# Altium project PoE_Controller_V1.0.PrjPcb (part 2 of 2)

## Sheet POE_Sheet.SchDoc
size A4; SheetNumber: 5; SheetTotal: 6
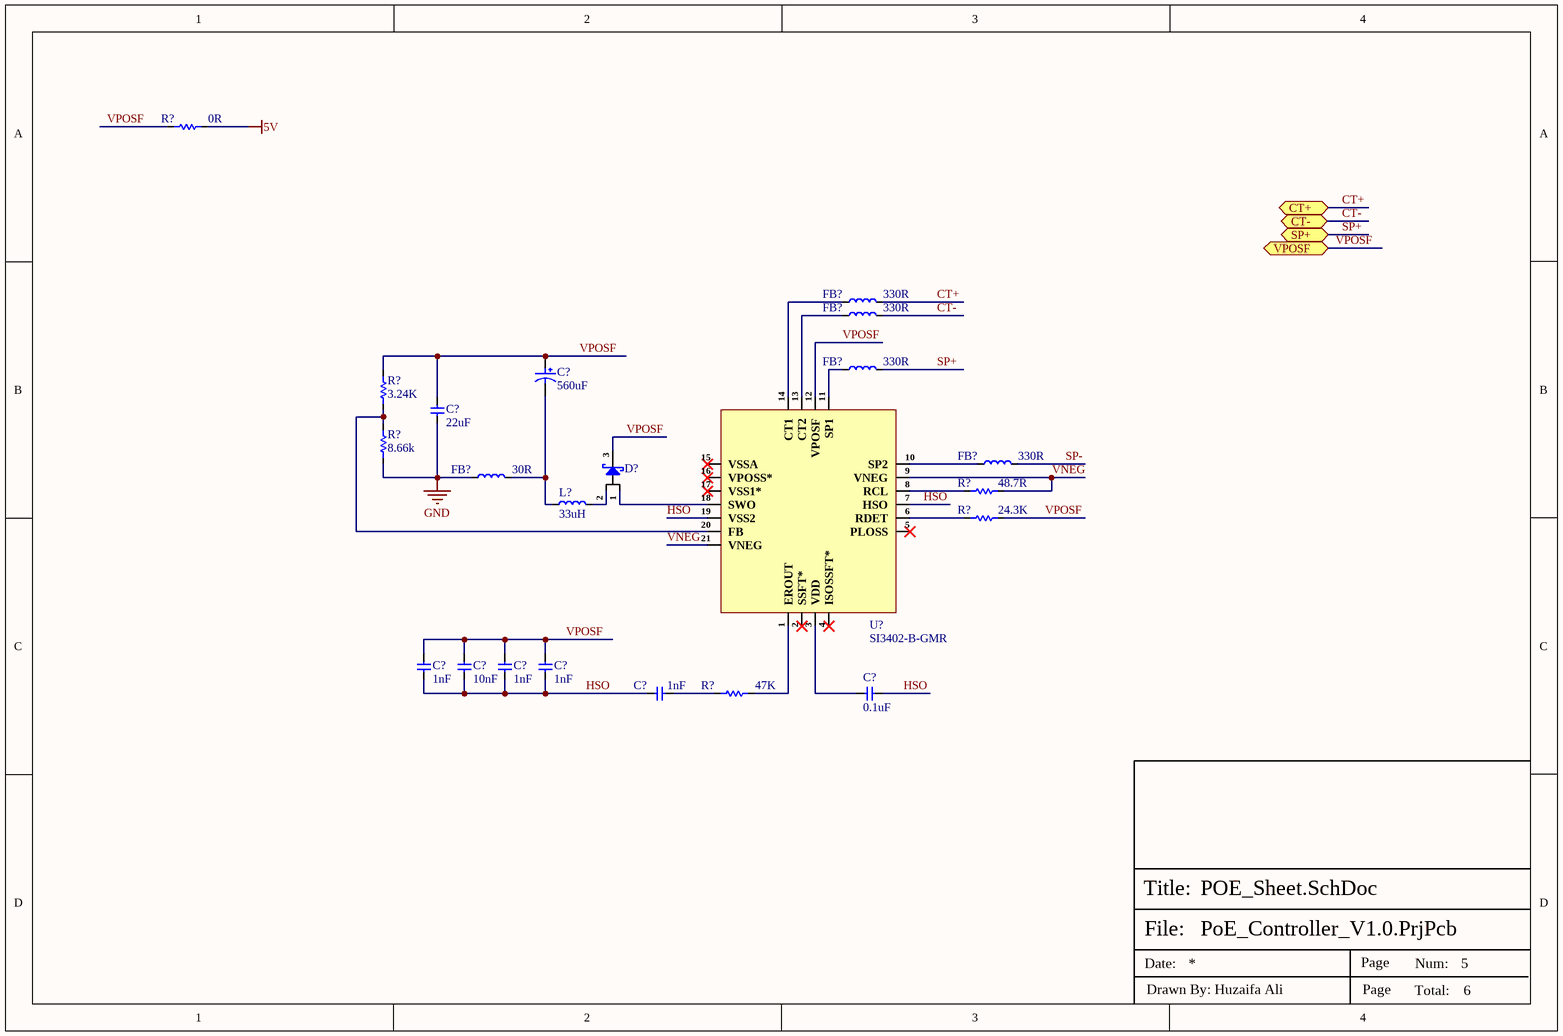
[diagram p4: POE_Sheet.SchDoc]

### Parts
(Parts that share a designator on the sheet are numbered #1, #2 ... from top to bottom, then left to right.)
C?#25  560uF  [GVT1C561M0810]
C?#26  22uF  [Cap-0805]
C?#27  1nF  [Cap-0603]
C?#28  10nF  [Cap-0603]
C?#29  1nF  [Cap-0603]
C?#30  1nF  [Cap-0603]
C?#31  1nF  [Cap-0603]
C?#32  0.1uF  [Cap-0603]
D?  PDS5100-13  [Power-DI-5]  (value not drawn)
FB?#1  330R  [Ind-0805]
FB?#2  330R  [Ind-0805]
FB?#3  330R  [Ind-0805]
FB?#4  330R  [Ind-0805]
FB?#5  30R  [IND-0603 (1608 Metric)]
L?#2  33uH  [MSS1278-333MLD]
R?#17  0R  [Res-0603]
R?#18  3.24K  [Res-0603]
R?#19  8.66k  [Res-0402]
R?#20  48.7R  [Res-0603]
R?#21  24.3K  [Res-0603]
R?#22  47K  [Res-0603]
U?#2  SI3402-B-GMR  [20-QFN (5x5)]

### Ports
CT+ (bidir, see Connector_Sheet[2D]), CT- (bidir, see Connector_Sheet[2D]), SP+ (bidir, see Connector_Sheet[2D]), VPOSF (bidir, see Connector_Sheet[2D])

### Nets
5V: R?#17.2
GND: C?#26.1 FB?#5.1 R?#19.1  [project net 3V3]
CT+: FB?#1.2 ; port CT+
CT-: FB?#2.2 ; port CT-
HSO: C?#27.1 C?#28.1 C?#29.1 C?#30.1 C?#31.1 C?#32.1 U?#2.7(HSO) U?#2.19(VSS2)
SP+: FB?#3.2 ; port SP+
SP-: FB?#4.2
VNEG: R?#20.2 U?#2.9(VNEG) U?#2.21(VNEG)
VPOSF: C?#25.1 C?#26.2 C?#27.2 C?#28.2 C?#29.2 C?#30.2 D?.3(K) R?#17.1 R?#18.2 R?#21.2 U?#2.12(VPOSF) ; port VPOSF
NetC?#25_2: C?#25.2 FB?#5.2 L?#2.2
NetC?#31_2: C?#31.2 R?#22.1
NetC?#32_2: C?#32.2 U?#2.3(VDD)
NetD?_1: D?.1(A) U?#2.18(SWO)
NetD?_2: D?.2(A) L?#2.1
NetFB?#1_1: FB?#1.1 U?#2.14(CT1)
NetFB?#2_1: FB?#2.1 U?#2.13(CT2)
NetFB?#3_1: FB?#3.1 U?#2.11(SP1)
NetFB?#4_1: FB?#4.1 U?#2.10(SP2)
NetR?#18_1: R?#18.1 R?#19.2 U?#2.20(FB)
NetR?#20_1: R?#20.1 U?#2.8(RCL)
NetR?#21_1: R?#21.1 U?#2.6(RDET)
NetR?#22_2: R?#22.2 U?#2.1(EROUT)

Not connected (* = marked no-connect by the designer): U?#2 2(SSFT*)* 4(ISOSSFT*)* 5(PLOSS)* 15(VSSA)* 16(VPOSS*)* 17(VSS1*)*

### Notes on the sheet
- File:
- Title:
- Date:
- Page
- Num:
- Total:
- Drawn By: Huzaifa Ali

### Library data of the parts
C?#25 = GVT1C561M0810: 560uF 16V ±20% SMD,D8xL10.5mm Aluminum Electrolytic Capacitors - SMD ROHS; Manufacturer: Honor Elec; Manufacturer Part Number: GVT1C561M0810; Package: SMD,D8xL10.5mm; LCSC Part Number: C2980166; Item Type: Capacitor; ComponentLink1Description: LCSC; ComponentLink1URL: https://www.lcsc.com/product-detail/span-style-background-color-ff0-Aluminum-span-span-style-background-color-ff0-Electrolytic-span-span-style-background-color-ff0-Capacitors-span-span-style-background-color-ff0-SMD-span_Honor-Elec-GVT1C561M0810_C2980166.html
C?#26 = CC0805MKX5R8BB226: CAP CER 22UF 25V X5R 0805; Manufacturer: Yageo; Tolerance: 20%; Item Type: Capacitor; Supplier 1: Digi-Key; Manufacturer Part Number: CC0805MKX5R8BB226; RoHS: Yes; Category: Ceramic Capacitors; Stock 1: 64970; Pricing 1: 1=0.47000, 10=0.33300, 50=0.25140, 100=0.21900, 500=0.16222, 1000=0.13789 (USD); Mount: Surface Mount; Case/Package: 0805; Case Code (Metric): 2012; Case Code (Imperial): 0805; Weight: 0.000194oz; Min Operating Temperature: -55°C; Max Operating Temperature: 85°C; Packaging: Tape and Reel; Capacitance: 22uF; Voltage Rating: 25V; Dielectric: X5R; Termination: SMD/SMT; Voltage Rating (DC): 25V; Package Quantity: 3000; Length: 0.079inch; Width: 0.049inch; Height: 1.25mm; Thickness: 0.057inch; Lead Free: Lead Free; Halogen Free: Halogen Free; RoHS Compliant: Yes; ComponentLink1URL: http://www.mouser.com/ds/2/447/Yageo_UPY-GP_NP0_16V-to-50V_9-358835.pdf?src-supplier=Mouser; ComponentLink1Description: http://www.mouser.com/ds/2/447/Yageo_UPY-GP_NP0_16V-to-50V_9-358835.pdf?src-supplier=Mouser; ComponentLink2URL: http://www.yageo.com/documents/recent/UPY-GPHC_X5R_4V-to-50V_25.pdf?src-supplier=Digi-Key; ComponentLink2Description: http://www.yageo.com/documents/recent/UPY-GPHC_X5R_4V-to-50V_25.pdf?src-supplier=Digi-Key; Supplier Part Number 1: 311-1903-1-ND; LCSC Part Number: C784585
C?#27 C?#29-C?#31 = CL10C102JB8NNNC: CAP CER 1000PF 50V C0G/NP0 0603; Manufacturer: Samsung; Material: Ceramic; Tolerance: 5%; Dielectric: C0G; Temperature Coefficient: 300ppm/°C; Item Type: Capacitor; Supplier 1: RSComponents; Manufacturer Part Number: CL10C102JB8NNNC; RoHS: Yes; Category: Ceramic Capacitors; Stock 1: 616000; Pricing 1: 4000=0.00600, 12000=0.00600, 20000=0.00600, 40000=0.00500, 100000=0.00500 (GBP); Mount: Surface Mount; Case/Package: 0603; Case Code (Metric): 1608; Case Code (Imperial): 0603; Min Operating Temperature: -55°C; Max Operating Temperature: 125°C; Capacitance: 1nF; Voltage: 50V; Voltage Rating (DC): 50V; Voltage Rating: 50V; Packaging: Tape and Reel; Package Quantity: 1; Series: CL; Length: 1.6mm; Width: 0.031inch; Height: 0.8mm; Depth: 0.8mm; Thickness: 0.035inch; Radiation Hardening: No; Lead Free: Lead Free; RoHS Compliant: Yes; ComponentLink1URL: https://datasheet.ciiva.com/15195/getdatasheetpartid-354056-15195790.pdf?src-supplier=Verical; ComponentLink1Description: https://datasheet.ciiva.com/15195/getdatasheetpartid-354056-15195790.pdf?src-supplier=Verical; ComponentLink2URL: https://datasheet.ciiva.com/29198/458273-da-01-en-vs-kondensator-0603-29198494.pdf?src-supplier=Conrad; ComponentLink2Description: https://datasheet.ciiva.com/29198/458273-da-01-en-vs-kondensator-0603-29198494.pdf?src-supplier=Conrad; ComponentLink3URL: https://datasheet.ciiva.com/26310/mlcc-catalogdownload2013-eng-26310329.pdf?src-supplier=Distrelec; ComponentLink3Description: https://datasheet.ciiva.com/26310/mlcc-catalogdownload2013-eng-26310329.pdf?src-supplier=Distrelec; Supplier Part Number 1: 7665279; LCSC Part Number: C163508
C?#28 = CC0603KRX7R9BB103: CAP CER 10000PF 50V X7R 0603; Manufacturer: Yageo; Material: Ceramic; Tolerance: 10%; Insulation Resistance: 100GR; Supplier 1: Digi-Key; Manufacturer Part Number: CC0603KRX7R9BB103; Stock 1: 8411467; Pricing 1: 1=0.1, 10=0.038, 100=0.0171, 500=0.01224, 1000=0.00962 (USD); Mount: Surface Mount; Case/Package: 0603; Number of Pins: 2; Case Code (Metric): 1608; Case Code (Imperial): 0603; Min Operating Temperature: -55°C; Max Operating Temperature: 125°C; Capacitance: 10nF; Dielectric: X7R; Voltage: 50V; Packaging: Tape and Reel; Voltage Rating: 50V; Voltage Rating (DC): 50V; Package Quantity: 1; Termination: SMD/SMT; Composition: Ceramic; Length: 1.6mm; Height: 0.8mm; Width: 0.031inch; Thickness: 0.035inch; Depth: 0.8mm; Radiation Hardening: No; REACH SVHC: No SVHC; Lead Free: Lead Free; Halogen Free: Halogen Free; ComponentLink1URL: http://www.farnell.com/datasheets/1734573.pdf?src-supplier=Element14; ComponentLink1Description: http://www.farnell.com/datasheets/1734573.pdf?src-supplier=Element14; ComponentLink2URL: http://www.yageo.com/documents/recent/UPY-GPHC_X7R_6.3V-to-50V_18.pdf?src-supplier=Digi-Key; ComponentLink2Description: http://www.yageo.com/documents/recent/UPY-GPHC_X7R_6.3V-to-50V_18.pdf?src-supplier=Digi-Key; ComponentLink3URL: http://www.farnell.com/datasheets/2167236.pdf?src-supplier=Mouser; ComponentLink3Description: http://www.farnell.com/datasheets/2167236.pdf?src-supplier=Mouser; ComponentLink4URL: http://www.farnell.com/datasheets/70765.pdf?src-supplier=Element14; ComponentLink4Description: http://www.farnell.com/datasheets/70765.pdf?src-supplier=Element14; ComponentLink5URL: http://www.yageo.com/documents/recent/UPY-GPHC_X7R_6.3V-to-50V_8.pdf?src-supplier=Avnet+Europe; ComponentLink5Description: http://www.yageo.com/documents/recent/UPY-GPHC_X7R_6.3V-to-50V_8.pdf?src-supplier=Avnet+Europe; ComponentLink6URL: http://www.farnell.com/datasheets/1489800.pdf?src-supplier=Element14; ComponentLink6Description: http://www.farnell.com/datasheets/1489800.pdf?src-supplier=Element14; ComponentLink7URL: https://www.verical.com/server-webapp/html/getDatasheet?partID=403582&src-supplier=Verical; ComponentLink7Description: https://www.verical.com/server-webapp/html/getDatasheet?partID=403582&src-supplier=Verical; Supplier Part Number 1: 311-1085-6-ND; LCSC Part Number: C100042
C?#32 = CL10B104KB8NNNC: CAP CER 0.1UF 50V X7R 0603; Manufacturer: Samsung; Material: Ceramic; Capacitance: 100nF; Tolerance: 10%; Supplier 1: Digi-Key; Manufacturer Part Number: CL10B104KB8NNNC; RoHS: Yes; Category: Ceramic Capacitors; Stock 1: 3998791; Pricing 1: 1=0.10000, 10=0.03000, 50=0.01640, 100=0.01340, 500=0.00954, 1000=0.00750 (USD); Mount: Surface Mount; Case/Package: 0603; Case Code (Metric): 1608; Case Code (Imperial): 0603; Contact Plating: Tin; Min Operating Temperature: -55°C; Max Operating Temperature: 125°C; Dielectric: X7R; Voltage Rating: 50V; Package Quantity: 1; Packaging: Tape and Reel; Voltage: 50V; Voltage Rating (DC): 50V; Series: CL; Construction: Flat; Length: 1.6mm; Width: 0.031inch; Height: 0.8mm; Depth: 0.8mm; Thickness: 0.035inch; Radiation Hardening: No; Lead Free: Lead Free; RoHS Compliant: Yes; ComponentLink1URL: https://datasheet.ciiva.com/25803/cl10b104kb8nnnc-25803393.pdf?src-supplier=Digi-Key; ComponentLink1Description: https://datasheet.ciiva.com/25803/cl10b104kb8nnnc-25803393.pdf?src-supplier=Digi-Key; ComponentLink2URL: https://datasheet.ciiva.com/26838/getdatasheetpartid-89097-26838411.pdf?src-supplier=Verical; ComponentLink2Description: https://datasheet.ciiva.com/26838/getdatasheetpartid-89097-26838411.pdf?src-supplier=Verical; ComponentLink3URL: https://datasheet.ciiva.com/29198/456651-da-01-en-vs-kondensator-0605-29198839.pdf?src-supplier=Conrad; ComponentLink3Description: https://datasheet.ciiva.com/29198/456651-da-01-en-vs-kondensator-0605-29198839.pdf?src-supplier=Conrad; Supplier Part Number 1: 1276-1000-1-ND; LCSC Part Number: C1591
D? = PDS5100-13: DIODE SCHOTTKY 100V 5A POWERDI5; Manufacturer: Diodes; Supplier: Future Electronics; Supplier Part Number: 7587892; Manufacturer Part Number: PDS5100-13; RoHS: Yes; Item Type: Diode; Stock: 15000; Pricing: 5000=0.51, 10000=0.49 (USD); ComponentLink1URL: https://datasheet.ciiva.com/4715/ds30483-85202-4715621.pdf?src-supplier=Mouser; ComponentLink1Description: https://datasheet.ciiva.com/4715/ds30483-85202-4715621.pdf?src-supplier=Mouser; ComponentLink2URL: https://datasheet.ciiva.com/23710/ds30483-23710529.pdf?src-supplier=Newark; ComponentLink2Description: https://datasheet.ciiva.com/23710/ds30483-23710529.pdf?src-supplier=Newark; ComponentLink3URL: https://datasheet.ciiva.com/8301/ds30483-8301032.pdf?src-supplier=Avnet; ComponentLink3Description: https://datasheet.ciiva.com/8301/ds30483-8301032.pdf?src-supplier=Avnet; ComponentLink4URL: https://datasheet.ciiva.com/8301/ds30483-8301036.pdf?src-supplier=Avnet; ComponentLink4Description: https://datasheet.ciiva.com/8301/ds30483-8301036.pdf?src-supplier=Avnet; ComponentLink5URL: https://datasheet.ciiva.com/915/ds30483-915146.pdf?src-supplier=Digikey; ComponentLink5Description: https://datasheet.ciiva.com/915/ds30483-915146.pdf?src-supplier=Digikey; ComponentLink6URL: https://datasheet.ciiva.com/915/ds30483-915147.pdf?src-supplier=Digikey; ComponentLink6Description: https://datasheet.ciiva.com/915/ds30483-915147.pdf?src-supplier=Digikey; ComponentLink7URL: https://datasheet.ciiva.com/915/ds30483-915148.pdf?src-supplier=Digikey; ComponentLink7Description: https://datasheet.ciiva.com/915/ds30483-915148.pdf?src-supplier=Digikey
FB?#1-FB?#4 = BLM21PG331SN1D: FERRITE BEAD 330 OHM 0805 1LN; Manufacturer: Murata; Number of Circuits: 1NUMBER; RMS Current (Irms): 1.5A; ESR: 70mR; Shielding: 202Shielding; Supplier: Mouser; Supplier Part Number: 81-BLM21P331SG; Manufacturer Part Number: BLM21PG331SN1D; RoHS: Yes; Category: Ferrite Beads and Chips; Stock: 246053; Pricing: 1=0.12, 10=0.064, 50=0.064, 100=0.044, 1000=0.031, 10000=0.025 (USD); Lead Free: 5697LeadFree; ComponentLink1URL: https://datasheet.ciiva.com/11799/0900766b81275e31-11799231.pdf?src-supplier=Rs; ComponentLink1Description: https://datasheet.ciiva.com/11799/0900766b81275e31-11799231.pdf?src-supplier=Rs; ComponentLink2URL: https://datasheet.ciiva.com/19460/1845347-19460239.pdf?src-supplier=Jameco; ComponentLink2Description: https://datasheet.ciiva.com/19460/1845347-19460239.pdf?src-supplier=Jameco; ComponentLink3URL: https://datasheet.ciiva.com/14122/anblm21p-data-e-14122215.pdf?src-supplier=Distrelec; ComponentLink3Description: https://datasheet.ciiva.com/14122/anblm21p-data-e-14122215.pdf?src-supplier=Distrelec; ComponentLink4URL: https://datasheet.ciiva.com/3081/l0110s0100blm21p-3081659.pdf?src-supplier=Avnet; ComponentLink4Description: https://datasheet.ciiva.com/3081/l0110s0100blm21p-3081659.pdf?src-supplier=Avnet; ComponentLink5URL: https://datasheet.ciiva.com/6211/l0110s0100blm21p-6211749.pdf?src-supplier=Digikey; ComponentLink5Description: https://datasheet.ciiva.com/6211/l0110s0100blm21p-6211749.pdf?src-supplier=Digikey; ComponentLink6URL: https://datasheet.ciiva.com/6211/l0110s0100blm21p-6211753.pdf?src-supplier=Digikey; ComponentLink6Description: https://datasheet.ciiva.com/6211/l0110s0100blm21p-6211753.pdf?src-supplier=Digikey; ComponentLink7URL: https://datasheet.ciiva.com/6211/l0110s0100blm21p-6211754.pdf?src-supplier=Digikey; ComponentLink7Description: https://datasheet.ciiva.com/6211/l0110s0100blm21p-6211754.pdf?src-supplier=Digikey; ComponentLink8URL: https://datasheet.ciiva.com/41449/001172367-da-01-en-drossel-0805-330r-2-0x1-25mm-4000st-41449610.pdf?src-supplier=Conrad; ComponentLink8Description: https://datasheet.ciiva.com/41449/001172367-da-01-en-drossel-0805-330r-2-0x1-25mm-4000st-41449610.pdf?src-supplier=Conrad
FB?#5 = BLM18PG300SN1D: FERRITE BEAD 30 OHM 0603 1LN / Ferrite Beads Multi-Layer 30Ohm 100MHz 1A 0.05Ohm DCR 0603 T/R; Manufacturer: Murata; Material: Steel,Ferrite; Tolerance: 25%; DC Resistance (DCR): 50mR; Number of Lines: 1; Shielding: Unshielded; Supplier 1: RSComponents; Manufacturer Part Number: BLM18PG300SN1D; RoHS: Yes; Category: Inductors; Stock 1: 3100; Pricing 1: 25=0.07200, 1000=0.06200, 2000=0.05400, 5000=0.04700, 10000=0.04300 (GBP); Case/Package: 0603; Number of Pins: 2; Core Material: Ferrite; Case Code (Metric): 1608; Case Code (Imperial): 0603; Min Operating Temperature: -55°C; Max Operating Temperature: 125°C; Impedance: 30R; Package Quantity: 4000; Max Current Rating: 1A; Packaging: Tape and Reel; Current Rating: 1A; Max DC Current: 1A; Termination: SMD/SMT; Test Frequency: 100MHz; DC Current: 1A; Frequency: 100MHz; Number of Circuits: 1; Series: BLM18P; DC Resistance-Max: 50mR; Length: 1.6mm; Width: 0.8mm; Height: 0.8mm; Depth: 0.8mm; Radiation Hardening: No; REACH SVHC: No SVHC; Lead Free: Lead Free; RoHS Compliant: Yes; ComponentLink1URL: https://datasheet.ciiva.com/19460/1845048-19460200.pdf?src-supplier=Jameco; ComponentLink1Description: https://datasheet.ciiva.com/19460/1845048-19460200.pdf?src-supplier=Jameco; ComponentLink2URL: https://datasheet.ciiva.com/11800/0900766b81275ca5-11800868.pdf?src-supplier=RSComponents; ComponentLink2Description: https://datasheet.ciiva.com/11800/0900766b81275ca5-11800868.pdf?src-supplier=RSComponents; ComponentLink3URL: https://datasheet.ciiva.com/8021/5148-8021484.pdf?src-supplier=Element14; ComponentLink3Description: https://datasheet.ciiva.com/8021/5148-8021484.pdf?src-supplier=Element14; ComponentLink4URL: https://datasheet.ciiva.com/8021/5148-8021486.pdf?src-supplier=Element14; ComponentLink4Description: https://datasheet.ciiva.com/8021/5148-8021486.pdf?src-supplier=Element14; ComponentLink5URL: https://datasheet.ciiva.com/1012/l0110s0100blm18p-1012120.pdf?src-supplier=Digi-Key; ComponentLink5Description: https://datasheet.ciiva.com/1012/l0110s0100blm18p-1012120.pdf?src-supplier=Digi-Key; ComponentLink6URL: https://datasheet.ciiva.com/1012/l0110s0100blm18p-1012119.pdf?src-supplier=Digi-Key; ComponentLink6Description: https://datasheet.ciiva.com/1012/l0110s0100blm18p-1012119.pdf?src-supplier=Digi-Key; ComponentLink7URL: https://datasheet.ciiva.com/1012/l0110s0100blm18p-1012121.pdf?src-supplier=Digi-Key; ComponentLink7Description: https://datasheet.ciiva.com/1012/l0110s0100blm18p-1012121.pdf?src-supplier=Digi-Key; ComponentLink8URL: https://datasheet.ciiva.com/3081/l0110s0100blm18p-3081636.pdf?src-supplier=Avnet; ComponentLink8Description: https://datasheet.ciiva.com/3081/l0110s0100blm18p-3081636.pdf?src-supplier=Avnet; Supplier Part Number 1: 7241403; LCSC Part Number: C17305; Item Type: Ferrite Bead
L?#2 = MSS1278-333MLD: POWER INDUCTOR, SHIELDED, 10/20%; Manufacturer: Coilcraft; Item Type: Fixed Inductors; Core Material: Ferrite; Self Resonant Frequency: 9.5MHz; Tolerance: 20%; Max DC Current: 3.1A; Test Frequency: 100kHz; Saturation Current: 5.22A; Supplier: Mouser; Supplier Part Number: 994-MSS1278-333MLD; Manufacturer Part Number: MSS1278-333MLD; RoHS: Yes; Stock: 37813; Pricing: 1=2.92, 10=2.92, 50=2.92, 100=2.92, 1000=1.19, 10000=1.19 (USD); Mounting Technology: Surface Mount; Case/Package: SMD/SMT; Min Operating Temperature: -40°C; Max Operating Temperature: 85°C; Packaging: Tape and Reel; Package Quantity: 500; Shielding: Shielded; Value: 33uH; Termination: SMD/SMT; Series: MSS1278; Inductance Tolerance: 20%; RMS Current (Irms): 3.1A; Length: 12.3mm; Width: 12.3mm; Height: 8.05mm; Lead Free: Contains Lead; RoHS Compliant: Yes; Reach SVHC Compliant: No; ComponentLink1URL: https://datasheet.ciiva.com/22707/1681956-22707189.pdf?src-supplier=Element14; ComponentLink1Description: https://datasheet.ciiva.com/22707/1681956-22707189.pdf?src-supplier=Element14; ComponentLink2URL: https://datasheet.ciiva.com/22707/1681956-22707190.pdf?src-supplier=Element14; ComponentLink2Description: https://datasheet.ciiva.com/22707/1681956-22707190.pdf?src-supplier=Element14; ComponentLink3URL: https://datasheet.ciiva.com/13320/mss1278-270709-13320521.pdf?src-supplier=Mouser; ComponentLink3Description: https://datasheet.ciiva.com/13320/mss1278-270709-13320521.pdf?src-supplier=Mouser
R?#17 = RC0603FR-070RL: RES SMD 0R, 1%, 0.1W, 0603; Manufacturer: Yageo; Item Type: Resistor; Manufacturer Part Number: RC0603FR-070RL; Package: 0603; LCSC Part Number: C100044; ComponentLink9Description: LCSC; ComponentLink9URL: https://www.lcsc.com/product-detail/Chip-Resistor-Surface-Mount_YAGEO-RC0603FR-070RL_C100044.html
R?#18 = 0603WAF3241T5E: 100mW Thick Film Resistors ±1% 3.24kΩ 0603 Chip Resistor - Surface Mount ROHS; Manufacturer: UNI-ROYAL; Manufacturer Part Number: 0603WAF3241T5E; Package: 0603; LCSC Part Number: C22994; Item Type: Resistor; ComponentLink1Description: LCSC; ComponentLink1URL: https://www.lcsc.com/product-detail/Chip-Resistor-Surface-Mount_UNI-ROYAL-Uniroyal-Elec-0603WAF3241T5E_C22994.html
R?#19 = RT0402BRD078K66L: RES SMD 8.66KOHM 0.1% 1/16W 0402; Manufacturer: Yageo; Item Type: Resistor; Supplier: Mouser; Supplier Part Number: 603-RT0402BRD078K66L; Manufacturer Part Number: RT0402BRD078K66L; RoHS: Yes; Category: Chip SMD Resistors; Stock: 7615; Pricing: 1=0.38, 10=0.171, 50=0.171, 100=0.077, 1000=0.052, 10000=0.041 (USD); ComponentLink1URL: https://datasheet.ciiva.com/12721/pyu-rt-1-to-0-05-rohs-l-4-12721182.pdf?src-supplier=Mouser; ComponentLink1Description: https://datasheet.ciiva.com/12721/pyu-rt-1-to-0-05-rohs-l-4-12721182.pdf?src-supplier=Mouser; ComponentLink2URL: https://datasheet.ciiva.com/2582/pyu-rt-1-to-0-05-rohs-l-5-2582522.pdf?src-supplier=Digikey; ComponentLink2Description: https://datasheet.ciiva.com/2582/pyu-rt-1-to-0-05-rohs-l-5-2582522.pdf?src-supplier=Digikey; LCSC Part Number: C852945
R?#20 = RC0603FR-0748R7L: RES 48.7 OHM 1% 1/10W 0603; Manufacturer: Yageo; Item Type: Resistor; Supplier: Future Electronics; Supplier Part Number: 1337532; Manufacturer Part Number: RC0603FR-0748R7L; RoHS: Yes; Stock: 80000; Pricing: 5000=0.0012, 75000=0.0012, 200000=0.0011, 500000=0.0011, 1250000=0.001 (USD); ComponentLink1URL: https://datasheet.ciiva.com/8888/pyu-rc0603-51-rohs-l-4-8888942.pdf?src-supplier=Avnet; ComponentLink1Description: https://datasheet.ciiva.com/8888/pyu-rc0603-51-rohs-l-4-8888942.pdf?src-supplier=Avnet
R?#21 = RC0603FR-0724K3L: RES 24.3K OHM 1% 1/10W 0603; Manufacturer: Yageo; Item Type: Resistors; Voltage Rating (DC): 50V; Supplier: Future Electronics; Supplier Part Number: 6938161; Manufacturer Part Number: RC0603FR-0724K3L; RoHS: Yes; Stock: 440000; Pricing: 5000=0.0015, 50000=0.0014, 150000=0.0014, 375000=0.0013, 1000000=0.0012 (USD); Lead Free: 5697LeadFree; ComponentLink1URL: https://datasheet.ciiva.com/15189/getdatasheetpartid-326710-15189669.pdf?src-supplier=Verical; ComponentLink1Description: https://datasheet.ciiva.com/15189/getdatasheetpartid-326710-15189669.pdf?src-supplier=Verical
R?#22 = RT0603BRD0747KL: RES SMD 47K OHM 0.1% 1/10W 0603; Manufacturer: Yageo; Voltage Rating: 75V; Resistance: 47kR; Power Rating: 100mW; Temperature Coefficient: 25ppm/°C; Voltage Rating (DC): 50V; Item Type: Resistor; Supplier 1: Arrow Electronics; Manufacturer Part Number: RT0603BRD0747KL; RoHS: Yes; Category: Chip SMD Resistors; Stock 1: 5153; Pricing 1: 1=0.29190, 10=0.22910, 25=0.22680, 100=0.09530, 250=0.09440, 500=0.09340, 1000=0.04780, 3000=0.03070 (USD); Case/Package: 0603; Case Code (Metric): 1608; Case Code (Imperial): 0603; Contact Plating: Tin,Lead; Min Operating Temperature: -55°C; Max Operating Temperature: 125°C; Packaging: Tape and Reel; Package Quantity: 5000; Resistor Type: Thin Film; Termination: SMD/SMT; Number of Terminations: 2; Max Power Dissipation: 100mW; Features: Moisture Resistant; Series: RT; Construction: Rectangular; Length: 0.063inch; Width: 0.031inch; Height: 0.022inch; Depth: 0.8mm; Military Standard: Not; Lead Free: Lead Free; RoHS Compliant: Yes; ComponentLink1URL: https://datasheet.ciiva.com/2585/pyu-rt-1-to-0-05-rohs-l-4-2585964.pdf?src-supplier=Digi-Key; ComponentLink1Description: https://datasheet.ciiva.com/2585/pyu-rt-1-to-0-05-rohs-l-4-2585964.pdf?src-supplier=Digi-Key; ComponentLink2URL: https://datasheet.ciiva.com/46635/pyu-rt-1-to-0-05-rohs-l-5-46635309.pdf?src-supplier=Digi-Key; ComponentLink2Description: https://datasheet.ciiva.com/46635/pyu-rt-1-to-0-05-rohs-l-5-46635309.pdf?src-supplier=Digi-Key; Supplier Part Number 1: RT0603BRD0747KL; LCSC Part Number: C326725
U?#2 = SI3402-B-GMR: IC POE CNTRL 1 CHANNEL 20QFN; Manufacturer: Skyworks Solutions; Supplier: Digikey; Supplier Part Number: 336-4152-1-ND; Manufacturer Part Number: SI3402-B-GMR; RoHS: No; Item Type: IC; Stock: 11442; Pricing: 1=2.8, 10=2.516, 25=2.3736, 100=2.0222, 250=1.8988, 500=1.66144, 1000=1.37663 (USD)

## Sheet Connector_Sheet.SchDoc
size A4; SheetNumber: 6; SheetTotal: 6
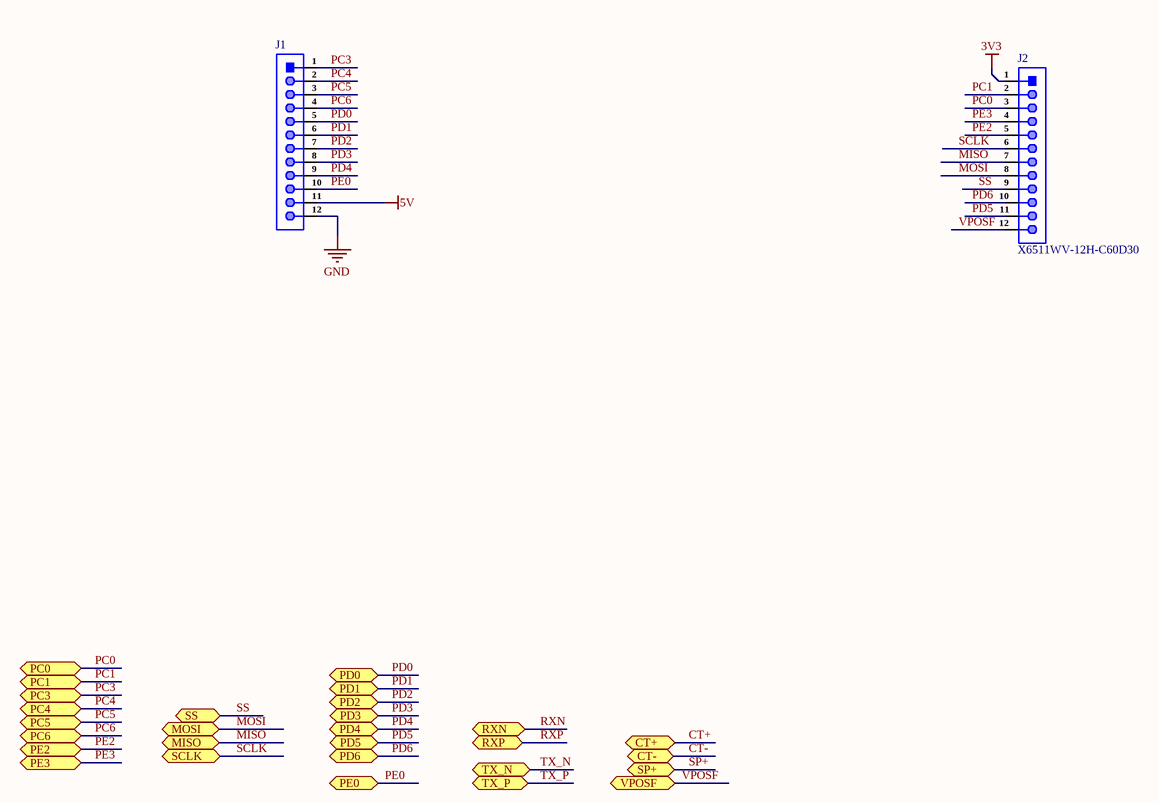
[diagram p5: Connector_Sheet.SchDoc]

### Parts
J1  X6511WV-12H-C60D30  [HDR 1x12 TH]  (value not drawn)
J2  X6511WV-12H-C60D30  [HDR 1x12 TH]

### Ports
CT+ (bidir, see POE_Sheet[4A]), CT- (bidir, see POE_Sheet[4A]), MISO (bidir, see Controller_Sheet[4B], Ethernet_Sheet[1D]), MOSI (bidir, see Controller_Sheet[4B], Ethernet_Sheet[1D]), PC0 (bidir, see Controller_Sheet[4B]), PC1 (bidir, see Controller_Sheet[4B]), PC3 (bidir, see Controller_Sheet[4B]), PC4 (bidir, see Controller_Sheet[4B]), PC5 (bidir, see Controller_Sheet[4B]), PC6 (bidir, see Controller_Sheet[4B]), PD0 (bidir, see Controller_Sheet[4C]), PD1 (bidir, see Controller_Sheet[4C]), PD2 (bidir, see Controller_Sheet[4C]), PD3 (bidir, see Controller_Sheet[4C]), PD4 (bidir, see Controller_Sheet[4C]), PD5 (bidir, see Controller_Sheet[4C]), PD6 (bidir, see Controller_Sheet[4C]), PE0 (bidir, see Controller_Sheet[4C]), PE2 (bidir, see Controller_Sheet[4B]), PE3 (bidir, see Controller_Sheet[4B]), RXN (bidir, see Ethernet_Sheet[1C]), RXP (bidir, see Ethernet_Sheet[1C]), SCLK (bidir, see Controller_Sheet[4B], Ethernet_Sheet[1D]), SP+ (bidir, see POE_Sheet[4A]), SS (bidir, see Controller_Sheet[4B]), TX_N (bidir, see Ethernet_Sheet[1C]), TX_P (bidir, see Ethernet_Sheet[1C]), VPOSF (bidir, see POE_Sheet[4A])

### Nets
3V3: J1.12 J2.1  [also labelled GND]
5V: J1.11
MISO: J2.7 ; port MISO
MOSI: J2.8 ; port MOSI
PC0: J2.3 ; port PC0
PC1: J2.2 ; port PC1
PC3: J1.1 ; port PC3
PC4: J1.2 ; port PC4
PC5: J1.3 ; port PC5
PC6: J1.4 ; port PC6
PD0: J1.5 ; port PD0
PD1: J1.6 ; port PD1
PD2: J1.7 ; port PD2
PD3: J1.8 ; port PD3
PD4: J1.9 ; port PD4
PD5: J2.11 ; port PD5
PD6: J2.10 ; port PD6
PE0: J1.10 ; port PE0
PE2: J2.5 ; port PE2
PE3: J2.4 ; port PE3
SCLK: J2.6 ; port SCLK
SS: J2.9 ; port SS
VPOSF: J2.12 ; port VPOSF

### Notes on the sheet
- File:
- Title:
- Date:
- Page
- Num:
- Total:
- Drawn By: Huzaifa Ali

### Library data of the parts
J1 J2 = X6511WV-12H-C60D30: Gold 250V 3A Square Pins 2.5mm 12P 260℃ 6mm -40℃~+105℃ 3mm 2.54mm Plugin Black Brass 2.54mm 1x12P Plugin,P=2.54mm Pin Headers ROHS; Manufacturer: XKB; Item Type: Male Header; Manufacturer Part Number: X6511WV-12H-C60D30; Package: Plugin,P=2.54mm; LCSC Part Number: C725944; ComponentLink1Description: LCSC; ComponentLink1URL: https://www.lcsc.com/product-detail/Pin-Headers_XKB-Connection-X6511WV-12H-C60D30_C725944.html

## Nets that join several sheets
3V3: Power_Sheet (7 pins), Controller_Sheet (11 pins), Ethernet_Sheet (21 pins), POE_Sheet (C?#26.1 FB?#5.1 R?#19.1), Connector_Sheet (J1.12 J2.1)
5V: Power_Sheet (C?#1.1 C?#3.2 U?#1.1), Controller_Sheet (5 pins), POE_Sheet (R?#17.2), Connector_Sheet (J1.11)
CS_WIZ: Controller_Sheet (U2.12), Ethernet_Sheet (U1.32)
INT_WIZ: Controller_Sheet (U2.13), Ethernet_Sheet (U1.36)
LDO_EN: Power_Sheet (U?#1.3), Controller_Sheet (U2.25)
MISO: Controller_Sheet (U2.16), Ethernet_Sheet (U1.34), Connector_Sheet (J2.7)
MOSI: Controller_Sheet (U2.15), Ethernet_Sheet (U1.35), Connector_Sheet (J2.8)
PC0: Controller_Sheet (U2.23), Connector_Sheet (J2.3)
PC1: Controller_Sheet (U2.24), Connector_Sheet (J2.2)
PC3: Controller_Sheet (U2.26), Connector_Sheet (J1.1)
PC4: Controller_Sheet (U2.27), Connector_Sheet (J1.2)
PC5: Controller_Sheet (U2.28), Connector_Sheet (J1.3)
PC6: Controller_Sheet (R?#1.1 U2.29), Connector_Sheet (J1.4)
PD0: Controller_Sheet (U2.30), Connector_Sheet (J1.5)
PD1: Controller_Sheet (U2.31), Connector_Sheet (J1.6)
PD2: Controller_Sheet (U2.32), Connector_Sheet (J1.7)
PD3: Controller_Sheet (U2.1), Connector_Sheet (J1.8)
PD4: Controller_Sheet (U2.2), Connector_Sheet (J1.9)
PD5: Controller_Sheet (U2.9), Connector_Sheet (J2.11)
PD6: Controller_Sheet (U2.10), Connector_Sheet (J2.10)
PE0: Controller_Sheet (U2.3), Connector_Sheet (J1.10)
PE2: Controller_Sheet (U2.19), Connector_Sheet (J2.5)
PE3: Controller_Sheet (U2.22), Connector_Sheet (J2.4)
RST_WIZ: Controller_Sheet (U2.11), Ethernet_Sheet (U1.37)
SCLK: Controller_Sheet (U2.17), Ethernet_Sheet (U1.33), Connector_Sheet (J2.6)
SS: Controller_Sheet (U2.14), Connector_Sheet (J2.9)
VPOSF: POE_Sheet (11 pins), Connector_Sheet (J2.12)